# Altium schematic sheet Powereg.SchDoc
size A; SheetNumber: 8; SheetTotal: 8
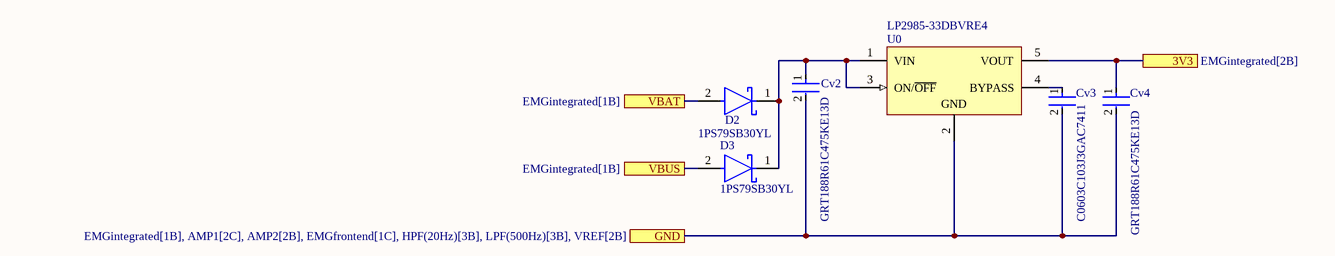
[diagram p0: Powereg.SchDoc]

## Parts
Cv2  GRT188R61C475KE13D  [FP-GRT188-0_15-IPC_C]
Cv3  C0603C103J3GAC7411  [FP-C0603C-CF-MFG]
Cv4  GRT188R61C475KE13D  [FP-GRT188-0_15-IPC_C]
D2  1PS79SB30YL  [FP-SOD523-MFG]
D3  1PS79SB30YL  [FP-SOD523-MFG]
U0  LP2985-33DBVRE4  [TI-DBV5_V]

## Ports
3V3 (see EMGintegrated[2B]), GND (see EMGintegrated[1B], AMP1[2C], AMP2[2B], EMGfrontend[1C], HPF(20Hz)[3B], LPF(500Hz)[3B], VREF[2B]), VBAT (see EMGintegrated[1B]), VBUS (see EMGintegrated[1B])

## Nets
3V3: Cv4.1 U0.5(VOUT) ; port 3V3
GND: Cv2.2 Cv3.2 Cv4.2 U0.2(GND) ; port GND
VBAT: D2.2(A) ; port VBAT
VBUS: D3.2(A) ; port VBUS
NetCv2_1: Cv2.1 D2.1(C) D3.1(C) U0.1(VIN) U0.3(ON/~{OFF})
NetCv3_1: Cv3.1 U0.4(BYPASS)

## Library data of the parts
Cv2 Cv4 = CMP-06035-009119-1: Multi-Layer Ceramic Capacitor 4.7uF 16V X5R ±10% 0603 Paper T/R; Mount: Surface Mount; Width: 0.031inch; Case Code (Imperial): 0603; Capacitance: 4.7uF; Thickness: 0.035inch; Packaging: Cut Tape; Min Operating Temperature: -55°C; Case Code (Metric): 1608; Case/Package: 0603; Tolerance: 10%; Length: 0.063inch; Ratings: AEC-Q200; Max Operating Temperature: 85°C; Voltage Rating: 16V
Cv3 = CMP-03020-031050-2: C0603 10,000 pF C0G 30ppm/°C 5.00% 25 V; Manufacturer: KEMET; Tolerance: 0.05; Automotive Grade: Grade 1; Voltage Rating: 25 V; Device Class L3: Ceramic Capacitors; ComponentLink2URL: https://api.kemet.com/component-edge/download/datasheet/C0603C100J5GACAUTO.pdf; Capacitance: 10,000 pF; RoHS: TRUE; Manufacturer Part Number: C0603C103J3GAC7411; Temperature Coefficient: 30ppm/°C; Lead Free: Yes; Height: 0.87mm; Temperature Range Low: -55°C; Value: 10,000 pF; Temperature Range High: +125°C; ComponentLink2Description: Datasheet; Material: Ceramic; Package: C0603C-CF; Temperature Characteristic: C0G; Temperature: -55°C to +125°C; Category: Cap; Octopart: https://octopart.com/c0603c103j3gac7411-kemet-91893810; Device Class L2: Capacitors; Device Class L1: Passive Components; Automotive: Yes
D2 D3 = CMP-14398-000044-1: Schottky Diode, Single, 150Deg C, Sod523 Rohs Compliant: Yes
U0 = CMP-0758-00029-1: Single Output Low Noise LDO, 150 mA, Fixed 3.3 V Output, 1.5% Tolerance, 2.2 to 16 V Input, Low IQ, 5-Pin SOT-23 (DBV), -40 to 125 degC, Green (RoHS & no Sb/Br), Tape and Reel; Manufacturer: Texas Instruments; Iout (Max) (A): 0.15; Output Options: Fixed Output; Fixed Output Options (V): 3.3; Vdo (Typ) (mV): 280; Accuracy (%): 1.5; Iq (Typ) (mA): 0.85; DatasheetVersion: SLVS522N; ComponentLink3URL: http://www.ti.com/litv/pdf/mpds018j; PackageDescription: 5-Pin Plastic Small Outline, Body 2.9 x 1.6 mm, Pitch 0.95 mm; PackageReference: DBV5; ComponentLink2URL: http://www.ti.com/lit/ds/symlink/lp2985-50.pdf; ComponentLink3Description: Package Specification; ComponentLink1URL: http://www.ti.com/; Operating Temperature Range (degC): -40 to 125; Mounting Technology: Surface Mount; PackageVersion: 4073253-4/L; ComponentLink2Description: Datasheet; ComponentLink1Description: Manufacturer URL; Packing: Tape and Reel; PartNumber: LP2985-33DBVRE4; Vin (V): 2.2 to 16; RoHS: TRUE